# Altium schematic sheet Controller Sheet ESP.SchDoc
size A; DocumentNumber: 4; SheetNumber: 4; SheetTotal: 6
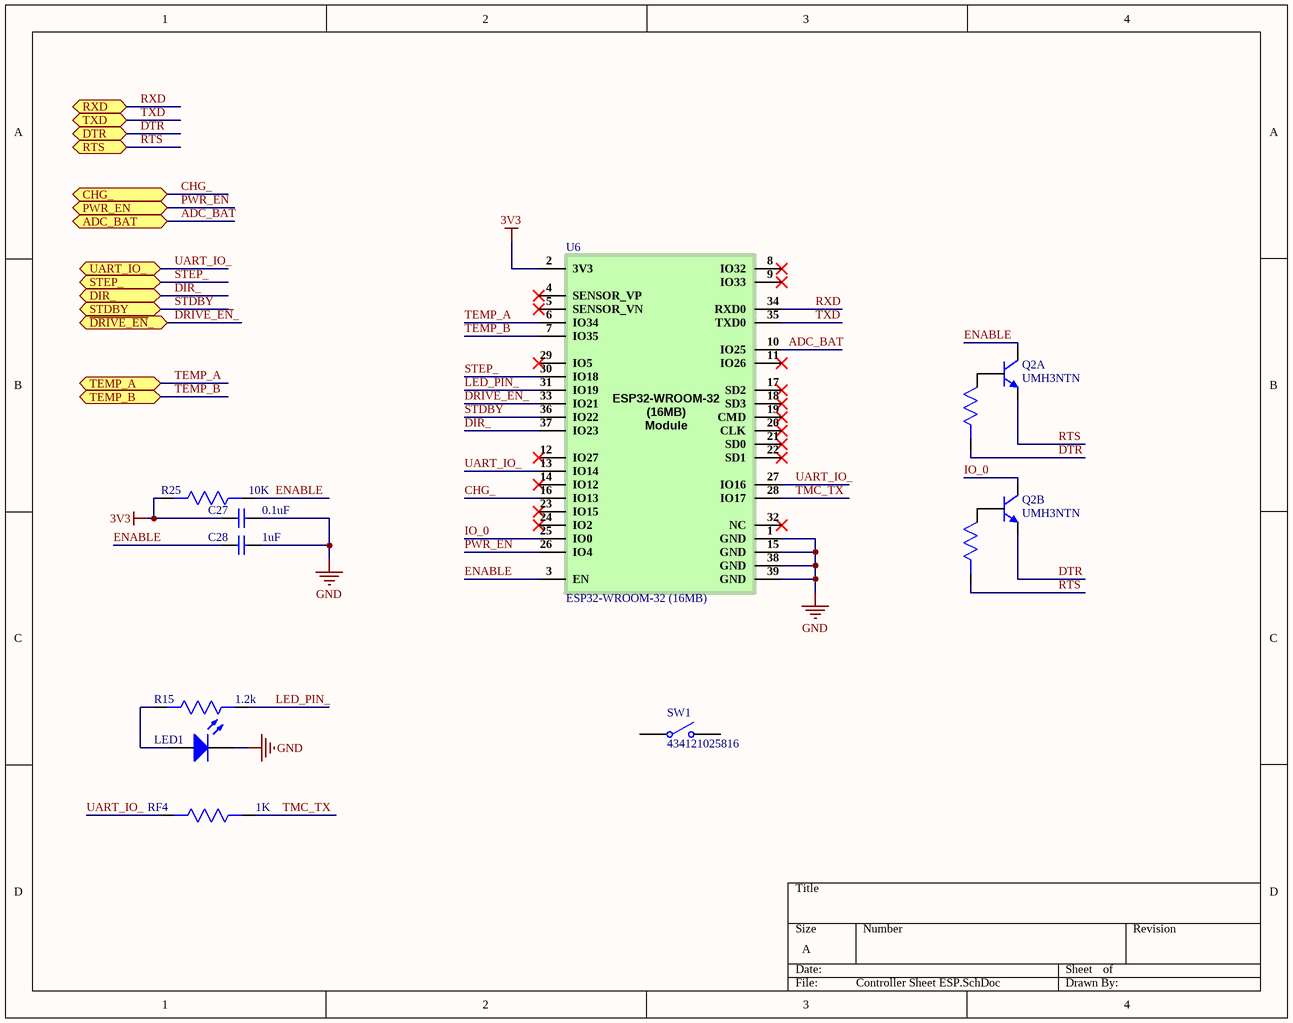
[diagram p0: Controller Sheet ESP.SchDoc]

## Parts
C27  0.1uF  [Cap 0201]
C28  1uF  [CAP 0201]
LED1  IN-S63AT5UW  [LED 0603]  (value not drawn)
Q2  UMH3NTN  [SOT-363]  (parts A,B of 2)
R15  1.2k  [Res-0201]
R25  10K  [Res-0201]
RF4  1K  [Res-0201]
SW1  434121025816  [434121025816]
U6  ESP32-WROOM-32 (16MB)  [ESP32-WROOM-32 (16MB)]

## Ports
ADC_BAT (bidir), CHG_ (bidir), DIR_ (bidir), DTR (bidir), PWR_EN (bidir), RTS (bidir), RXD (bidir), STDBY (bidir), STEP_ (bidir), TEMP_A (bidir), TEMP_B (bidir), TXD (bidir), UART_IO_ (bidir), ~{DRI}~{VE_EN}_ (bidir)

## Nets
3V3: C27.1 R25.2 U6.2(3V3)
GND: C27.2 C28.2 LED1.1(K) U6.1(GND) U6.15(GND) U6.38(GND) U6.39(GND)
~{DRI}~{VE_EN}_: U6.33(IO21) ; port ~{DRI}~{VE_EN}_
ADC_BAT: U6.10(IO25) ; port ADC_BAT
CHG_: U6.16(IO13) ; port CHG_
DIR_: U6.37(IO23) ; port DIR_
DTR: Q2.2 Q2.4(E) ; port DTR
ENABLE: C28.1 Q2.6(C) R25.1 U6.3(EN)
IO_0: Q2.3(C) U6.25(IO0)
LED_PIN_: R15.1 U6.31(IO19)
PWR_EN: U6.26(IO4) ; port PWR_EN
RTS: Q2.1(E) Q2.5 ; port RTS
RXD: U6.34(RXD0) ; port RXD
STDBY: U6.36(IO22) ; port STDBY
STEP_: U6.30(IO18) ; port STEP_
TEMP_A: U6.6(IO34) ; port TEMP_A
TEMP_B: U6.7(IO35) ; port TEMP_B
TMC_TX: RF4.1 U6.28(IO17)
TXD: U6.35(TXD0) ; port TXD
UART_IO_: RF4.2 U6.13(IO14) U6.27(IO16) ; port UART_IO_
NetLED1_2: LED1.2(A) R15.2

Not connected (* = marked no-connect by the designer): SW1 1 2; U6 4(SENSOR_VP)* 5(SENSOR_VN)* 8(IO32)* 9(IO33)* 11(IO26)* 12(IO27)* 14(IO12)* 17(SD2)* 18(SD3)* 19(CMD)* 20(CLK)* 21(SD0)* 22(SD1)* 23(IO15)* 24(IO2)* 29(IO5)* 32(NC)*

## Notes on the sheet
- (in symbol ESP32-WROOM-32 (16MB)) ESP32-WROOM-32 (16MB) Module

## Library data of the parts
C27 = GRM033R6YA104ME14D: CAP CER 0.1UF 35V X5R 0201; Manufacturer: Murata; Tolerance: 20%; Capacitance: 100nF; Supplier 1: Digi-Key; Manufacturer Part Number: GRM033R6YA104ME14D; RoHS: Yes; Category: Ceramic Capacitors; Stock 1: 49800; Pricing 1: 1=0.10000, 10=0.05600, 50=0.03040, 100=0.02490, 500=0.01778, 1000=0.01398, 2500=0.01270, 5000=0.01169 (USD); Mount: Surface Mount; Case/Package: 0201; Weight: 1.2E-05oz; Case Code (Metric): 0603; Case Code (Imperial): 0201; Min Operating Temperature: -55°C; Max Operating Temperature: 85°C; Dielectric: X5R; Termination: SMD/SMT; Voltage Rating (DC): 35V; Package Quantity: 15000; Packaging: Tape and Reel; Voltage Rating: 35V; Length: 0.024inch; Height: 0.3mm; Width: 0.012inch; Thickness: 0.013inch; ComponentLink1URL: http://www.mouser.com/ds/2/281/c02e-2905.pdf?src-supplier=Mouser; ComponentLink1Description: http://www.mouser.com/ds/2/281/c02e-2905.pdf?src-supplier=Mouser; ComponentLink2URL: http://search.murata.co.jp/Ceramy/image/img/A01X/G101/ENG/GRM033R6YA104ME14-01.pdf?src-supplier=Digi-Key; ComponentLink2Description: http://search.murata.co.jp/Ceramy/image/img/A01X/G101/ENG/GRM033R6YA104ME14-01.pdf?src-supplier=Digi-Key; Supplier Part Number 1: 490-10431-1-ND
C28 = CL03A105MO3NRNH: CAP CER 1UF 16V X5R 0201; Manufacturer: Samsung; Tolerance: 20%; Supplier 1: Digi-Key; Manufacturer Part Number: CL03A105MO3NRNH; RoHS: Yes; Category: Ceramic Capacitors; Stock 1: 66067; Pricing 1: 1=0.27000, 10=0.18500, 50=0.11080, 100=0.09360, 500=0.06406, 1000=0.05667, 2500=0.05421, 5000=0.04928 (USD); Mount: Surface Mount; Case/Package: 0201; Case Code (Metric): 0603; Case Code (Imperial): 0201; Min Operating Temperature: -55°C; Max Operating Temperature: 85°C; Packaging: Tape and Reel; Capacitance: 1uF; Voltage Rating: 16V; Length: 0.024inch; Width: 0.012inch; Thickness: 0.013inch; RoHS Compliant: Yes; ComponentLink1URL: http://www.samsungsem.com/kr/support/product-search/mlcc/CL03A105MO3NRNH.jsp?src-supplier=Digi-Key; ComponentLink1Description: http://www.samsungsem.com/kr/support/product-search/mlcc/CL03A105MO3NRNH.jsp?src-supplier=Digi-Key; Supplier Part Number 1: 1276-6798-1-ND
LED1 = IN-S63AT5UW: Led White Clear 0603 SMD; Manufacturer: Inolux; Lens Style: Flat; Luminous Intensity: 900mcd; Forward Voltage: 3V; Test Current: 5mA; Viewing Angle: 120°; Lens Size: 0.8mm; Supplier 1: Digi-Key; Manufacturer Part Number: IN-S63AT5UW; RoHS: No; Category: LEDs; Stock 1: 275915; Pricing 1: 1=0.33000, 10=0.17700, 100=0.08210, 500=0.07576, 1000=0.05934, 2000=0.05808 (USD); Mount: Surface Mount; Case/Package: 0603; Color: White; Lens Color: Clear; Case Code (Imperial): 0603; Case Code (Metric): 1608; Packaging: Tape and Reel; Lens Transparency: Clear; Length: 1.6mm; Width: 0.8mm; Height: 0.4mm; ComponentLink1URL: http://www.inolux-corp.com/datasheet/SMDLED/Mono%20Color%20Top%20View/IN-S63AT%20Series_V1.1.pdf?src-supplier=Digi-Key; ComponentLink1Description: http://www.inolux-corp.com/datasheet/SMDLED/Mono%20Color%20Top%20View/IN-S63AT%20Series_V1.1.pdf?src-supplier=Digi-Key; Supplier Part Number 1: 1830-1063-1-ND
Q2 = UMH3NTN: TRANS 2NPN PREBIAS 0.15W UMT6; Manufacturer: Rohm; Collector Emitter Voltage (VCEO): 50V; Emitter Base Voltage (VEBO): 5V; Max Collector Current: 100mA; Element Configuration: Dual; hFE Min: 100; Polarity: NPN; Power Dissipation: 150mW; Transition Frequency: 250MHz; Supplier 1: Digi-Key; Manufacturer Part Number: UMH3NTN; Stock 1: 12797; Pricing 1: 1=0.39, 10=0.293, 25=0.264, 100=0.1392, 500=0.12336, 1000=0.096 (USD); Mount: Surface Mount; Case/Package: SOT-363; Number of Pins: 6; Min Operating Temperature: -55°C; Max Operating Temperature: 150°C; Max Output Current: 100mA; Operating Supply Voltage: 50V; Packaging: Tape and Reel; Package Quantity: 1; Continuous Collector Current: 100mA; Collector Emitter Breakdown Voltage: 50V; Max Power Dissipation: 150mW; Max Breakdown Voltage: 50V; Voltage Rating (DC): 50V; Current Rating: 100mA; Collector Base Voltage (VCBO): 50V; Radiation Hardening: No; REACH SVHC: No SVHC; Lead Free: Lead Free; ComponentLink1URL: http://www.farnell.com/datasheets/1645293.pdf?src-supplier=Element14; ComponentLink1Description: http://www.farnell.com/datasheets/1645293.pdf?src-supplier=Element14; ComponentLink2URL: http://rohmfs.rohm.com/en/products/databook/datasheet/discrete/transistor/digital/emh3t2r-e.pdf?src-supplier=Digi-Key; ComponentLink2Description: http://rohmfs.rohm.com/en/products/databook/datasheet/discrete/transistor/digital/emh3t2r-e.pdf?src-supplier=Digi-Key; ComponentLink3URL: http://rohmfs.rohm.com/en/techdata_basic/transistor/taping/UMT6_TN_taping.pdf?src-supplier=Digi-Key; ComponentLink3Description: http://rohmfs.rohm.com/en/techdata_basic/transistor/taping/UMT6_TN_taping.pdf?src-supplier=Digi-Key; ComponentLink4URL: http://www.produktinfo.conrad.com/datenblaetter/125000-149999/140593-da-01-en-TRANSISTOR_UMH3_NTN_SOT_363.pdf?src-supplier=Conrad; ComponentLink4Description: http://www.produktinfo.conrad.com/datenblaetter/125000-149999/140593-da-01-en-TRANSISTOR_UMH3_NTN_SOT_363.pdf?src-supplier=Conrad; Supplier Part Number 1: UMH3NTNCT-ND
R15 = RC0201JR-071K2L: RES SMD 1.2K OHM 5% 1/20W 0201; Manufacturer: Yageo; Temperature Coefficient: 200ppm/°C; Resistance: 1.2kR; Max Power Dissipation: 50mW; Supplier 1: Digi-Key; Manufacturer Part Number: RC0201JR-071K2L; RoHS: Yes; Category: Chip SMD Resistors; Stock 1: 285; Pricing 1: 1=0.10000, 10=0.02600, 100=0.01040, 1000=0.00466, 2500=0.00405, 5000=0.00334 (USD); Case/Package: 0201; Contact Plating: Tin,Matte; Case Code (Imperial): 0201; Case Code (Metric): 0603; Min Operating Temperature: -55°C; Max Operating Temperature: 125°C; Resistor Type: Thick Film; Tolerance: 5%; Number of Terminations: 2; Package Quantity: 1; Packaging: Tape and Reel; Features: Moisture Resistant; Length: 0.024inch; Width: 0.012inch; Height: 0.01inch; Radiation Hardening: No; ComponentLink1URL: https://datasheet.ciiva.com/8895/pyu-rc0201-51-rohs-l-8-8895816.pdf?src-supplier=Avnet; ComponentLink1Description: https://datasheet.ciiva.com/8895/pyu-rc0201-51-rohs-l-8-8895816.pdf?src-supplier=Avnet; ComponentLink2URL: https://datasheet.ciiva.com/16855/pyu-rc0201-51-rohs-l-8-16855241.pdf?src-supplier=Avnet+Europe; ComponentLink2Description: https://datasheet.ciiva.com/16855/pyu-rc0201-51-rohs-l-8-16855241.pdf?src-supplier=Avnet+Europe; ComponentLink3URL: https://datasheet.ciiva.com/2462/pyu-r-int-thick-7-2462826.pdf?src-supplier=Digi-Key; ComponentLink3Description: https://datasheet.ciiva.com/2462/pyu-r-int-thick-7-2462826.pdf?src-supplier=Digi-Key; ComponentLink4URL: https://datasheet.ciiva.com/2462/pyu-r-int-thick-7-2462827.pdf?src-supplier=Digi-Key; ComponentLink4Description: https://datasheet.ciiva.com/2462/pyu-r-int-thick-7-2462827.pdf?src-supplier=Digi-Key; ComponentLink5URL: https://datasheet.ciiva.com/28418/pyu-rc0201-51-rohs-l-8-28418507.pdf?src-supplier=Avnet+Europe; ComponentLink5Description: https://datasheet.ciiva.com/28418/pyu-rc0201-51-rohs-l-8-28418507.pdf?src-supplier=Avnet+Europe; ComponentLink6URL: https://datasheet.ciiva.com/2462/pyu-r-int-thick-7-2462828.pdf?src-supplier=Digi-Key; ComponentLink6Description: https://datasheet.ciiva.com/2462/pyu-r-int-thick-7-2462828.pdf?src-supplier=Digi-Key; Supplier Part Number 1: 311-1.2KNCT-ND
R25 = RC0201JR-0710KL: RES SMD 10K OHM 5% 1/20W 0201; Manufacturer: Yageo; Voltage Rating (DC): 25V; Power Rating: 50mW; Resistance: 10kR; Temperature Coefficient: 200ppm/°C; Case Code (Imperial): 0201; Case Code (Metric): 0603; Case/Package: 0201; Category: Chip SMD Resistors; Contact Plating: Tin,Matte; Depth: 0.3mm; Lead Free: Lead Free; Length: 0.6mm; Manufacturer Part Number: RC0201JR-0710KL; Max Operating Temperature: 125°C; Military Standard: Not; Min Operating Temperature: -55°C; Packaging: Tape and Reel; Radiation Hardening: No; REACH SVHC: Unknown; Resistor Type: Thick Film; Termination: SMD/SMT; Tolerance: 5%; Voltage Rating: 25V; ComponentLink1Description: New link; ComponentLink1URL: *; Supplier 1: Digi-Key; RoHS: Yes; Stock 1: 1488597; Pricing 1: 1=0.10000, 10=0.02600, 100=0.01050, 1000=0.00472, 2500=0.00410, 5000=0.00338 (USD); ComponentLink2URL: https://datasheet.ciiva.com/8891/pyu-rc0201-51-rohs-l-8-8891388.pdf?src-supplier=Avnet; ComponentLink2Description: https://datasheet.ciiva.com/8891/pyu-rc0201-51-rohs-l-8-8891388.pdf?src-supplier=Avnet; ComponentLink3URL: https://datasheet.ciiva.com/7672/1563626-7672253.pdf?src-supplier=Element14; ComponentLink3Description: https://datasheet.ciiva.com/7672/1563626-7672253.pdf?src-supplier=Element14; ComponentLink4URL: https://datasheet.ciiva.com/28405/pyu-rc0201-51-rohs-l-8-28405613.pdf?src-supplier=Avnet+Europe; ComponentLink4Description: https://datasheet.ciiva.com/28405/pyu-rc0201-51-rohs-l-8-28405613.pdf?src-supplier=Avnet+Europe; ComponentLink5URL: https://datasheet.ciiva.com/7672/1563626-7672254.pdf?src-supplier=Element14; ComponentLink5Description: https://datasheet.ciiva.com/7672/1563626-7672254.pdf?src-supplier=Element14; ComponentLink6URL: https://datasheet.ciiva.com/7660/1421516-7660810.pdf?src-supplier=Element14; ComponentLink6Description: https://datasheet.ciiva.com/7660/1421516-7660810.pdf?src-supplier=Element14; ComponentLink7URL: https://datasheet.ciiva.com/16856/pyu-rc0201-51-rohs-l-8-16856011.pdf?src-supplier=Avnet+Europe; ComponentLink7Description: https://datasheet.ciiva.com/16856/pyu-rc0201-51-rohs-l-8-16856011.pdf?src-supplier=Avnet+Europe; ComponentLink8URL: https://datasheet.ciiva.com/46391/1421516-46391291.pdf?src-supplier=Element14; ComponentLink8Description: https://datasheet.ciiva.com/46391/1421516-46391291.pdf?src-supplier=Element14; Supplier Part Number 1: 311-10KNCT-ND
RF4 = RC0201FR-071KP: RES 1K OHM 1% 1/20W 0201; Manufacturer: Yageo; Supplier 1: Digi-Key; Manufacturer Part Number: RC0201FR-071KP; RoHS: Yes; Stock 1: 4800; Pricing 1: 1=0.11000, 10=0.10200, 100=0.03940, 1000=0.01734, 2500=0.01497, 5000=0.01340 (USD); RoHS Compliant: Yes; Supplier Part Number 1: 13-RC0201FR-071KPCT-ND
SW1 = 434121025816: SWITCH TACTILE SPST-NO 0.05A 12V; Manufacturer: Wurth Electronics; Mechanical Life: 50000Cycles; Actuator Material: Polymer,Liquid Crystal Polymer; Contact Current Rating: 50mA; Operating Force: 160gf; Illumination Type: Non-Illuminated,Illuminated; Throw Configuration: SPST; Insulation Resistance: 100MR; Switch Travel: 0.25mm; Switch Function: Off-Mom; Actuator Type: Standard; Actuator Length: 0.8mm; Supplier 1: Digi-Key; Manufacturer Part Number: 434121025816; RoHS: Yes; Category: Tactile Switches; Stock 1: 2355; Pricing 1: 1=0.55000, 50=0.50700, 100=0.46100, 500=0.41900, 1000=0.36400 (USD); Mount: Surface Mount; Contact Material: Stainless Steel,Steel; Min Operating Temperature: -40°C; Max Operating Temperature: 85°C; Current Rating: 50mA; Packaging: Tape and Reel; Termination: SMD/SMT; Length: 7.3mm; Width: 3.9mm; Height: 2.5mm; REACH SVHC: No SVHC; Lead Free: Lead Free; ComponentLink1URL: https://datasheet.ciiva.com/30466/0900766b8126b630-30466740.pdf?src-supplier=RSComponents; ComponentLink1Description: https://datasheet.ciiva.com/30466/0900766b8126b630-30466740.pdf?src-supplier=RSComponents; ComponentLink2URL: https://datasheet.ciiva.com/29123/711753-da-01-en-taster-434121025816-29123820.pdf?src-supplier=Conrad; ComponentLink2Description: https://datasheet.ciiva.com/29123/711753-da-01-en-taster-434121025816-29123820.pdf?src-supplier=Conrad; ComponentLink3URL: https://datasheet.ciiva.com/1532/434121025816-1532523.pdf?src-supplier=Element14; ComponentLink3Description: https://datasheet.ciiva.com/1532/434121025816-1532523.pdf?src-supplier=Element14; ComponentLink4URL: https://datasheet.ciiva.com/1633/434121025816-1633932.pdf?src-supplier=Farnell; ComponentLink4Description: https://datasheet.ciiva.com/1633/434121025816-1633932.pdf?src-supplier=Farnell; Supplier Part Number 1: 732-7045-1-ND
U6 = ESP32-WROOM-32 (16MB): WIFI MODULE 128MBITS SPI FLASH; Manufacturer: Espressif Systems; Manufacturer Part Number: ESP32-WROOM-32D(16MB); Interface: I2C,SPI,GPIO,PWM,SDIO,UART; Frequency: 2.5GHz; Data Rate: 150Mbps; Sensitivity: -98dBm; Memory Size: 536KB; Supplier 1: Mouser; Stock 1: 3620; Pricing 1: 1=4.5, 5=4.5 (USD); Mount: Surface Mount; Case/Package: SMD/SMT; Min Operating Temperature: -40°C; Max Operating Temperature: 85°C; Packaging: Tape and Reel; ComponentLink1URL: https://www.espressif.com/sites/default/files/documentation/esp32-wroom-32d_esp32-wroom-32u_datasheet_en.pdf?src-supplier=Digi-Key; ComponentLink1Description: https://www.espressif.com/sites/default/files/documentation/esp32-wroom-32d_esp32-wroom-32u_datasheet_en.pdf?src-supplier=Digi-Key; Supplier Part Number 1: 356-ES32WROOM32D16MB